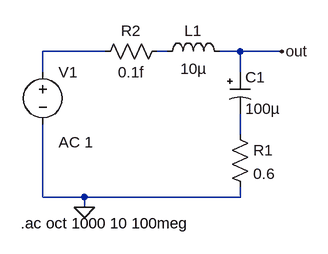
[diagram p0: schematic lc_filter2.asc]
lc_filter2.asc, the LTspice schematic file:
Version 4
SHEET 1 880 680
WIRE 64 80 -32 80
WIRE 160 80 144 80
WIRE 272 80 240 80
WIRE 336 80 272 80
WIRE -32 112 -32 80
WIRE 272 112 272 80
WIRE 272 208 272 176
WIRE -32 304 -32 192
WIRE 32 304 -32 304
WIRE 272 304 272 288
WIRE 272 304 32 304
WIRE 32 320 32 304
FLAG 32 320 0
FLAG 336 80 out
SYMBOL ind 144 96 R270
WINDOW 0 32 56 VTop 2
WINDOW 3 5 56 VBottom 2
SYMATTR InstName L1
SYMATTR Value 10µ
SYMATTR SpiceLine Ipk=1.04 Rser=0.12 Rpar=16970 Cpar=1.698p
SYMBOL polcap 256 112 R0
WINDOW 3 24 56 Left 2
SYMATTR InstName C1
SYMATTR Value 100µ
SYMATTR Description Capacitor
SYMATTR Type cap
SYMATTR SpiceLine V=63 Irms=500m Rser=0.1 Lser=0
SYMBOL voltage -32 96 R0
WINDOW 123 24 124 Left 2
WINDOW 39 0 0 Left 0
SYMATTR InstName V1
SYMATTR Value ""
SYMATTR Value2 AC 1
SYMBOL res 256 192 R0
SYMATTR InstName R1
SYMATTR Value 0.6
SYMBOL res 160 64 R90
WINDOW 0 0 56 VBottom 2
WINDOW 3 32 56 VTop 2
SYMATTR InstName R2
SYMATTR Value 0.1f
TEXT -66 344 Left 2 !.ac oct 1000 10 100meg

The netlist it stands for:
* lc_filter2.asc
L1 N002 out 10µ Ipk=1.04 Rser=0.12 Rpar=16970 Cpar=1.698p
C1 out N003 100µ V=63 Irms=500m Rser=0.1 Lser=0
V1 N001 0 AC 1
R1 N003 0 0.6
R2 N002 N001 0.1f
.ac oct 1000 10 100meg
.backanno
.end